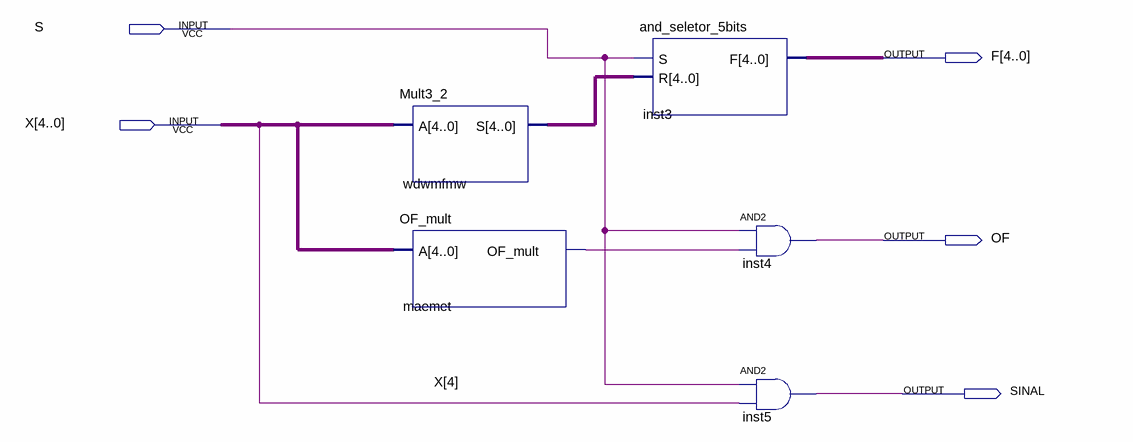
[diagram p0: schematic sheet]
// Quartus schematic BLOCO_mult.bdf as structural Verilog: 5 symbols, 5 pins
module BLOCO_mult (
  input  S,
  input  [4:0] X,
  output [4:0] F,
  output OF,
  output SINAL
);

  wire maemet_of_mult;
  wire [4:0] wdwmfmw_s;

  Mult3_2 wdwmfmw (.A(X), .S(wdwmfmw_s));
  OF_mult maemet (.A(X), .OF_mult(maemet_of_mult));
  and_seletor_5bits inst3 (.S(S), .R(wdwmfmw_s), .F(F));
  and inst4 (OF, S, maemet_of_mult);
  and inst5 (SINAL, S, X[4]);
endmodule
